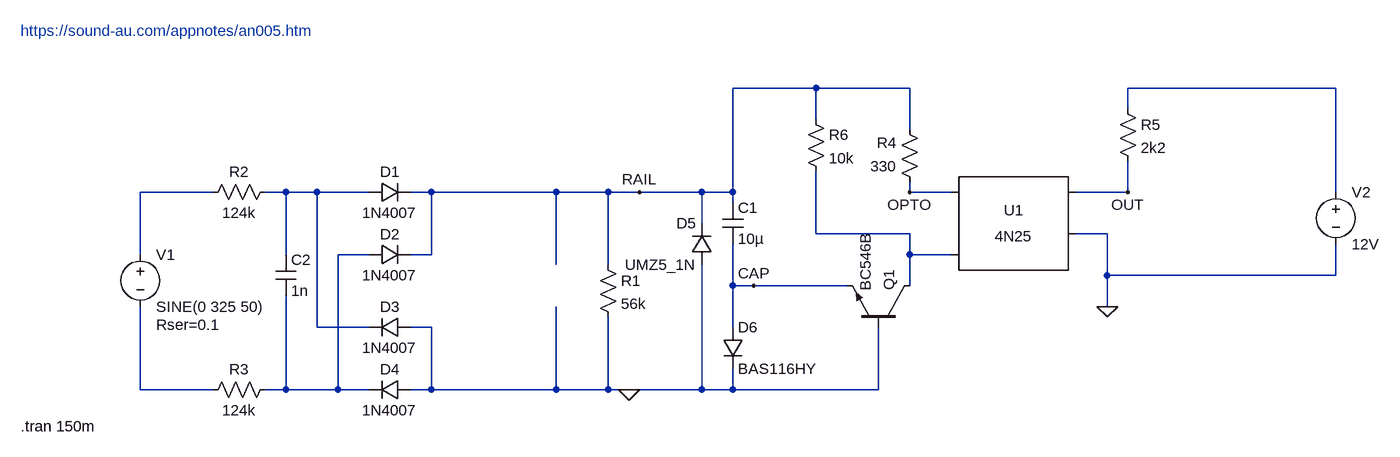
[diagram p0: schematic zero_crossing_ESP.asc]
zero_crossing_ESP.asc, the LTspice schematic file:
Version 4.1
SHEET 1 2200 752
WIRE 1168 112 1040 112
WIRE 1312 112 1168 112
WIRE 1968 112 1648 112
WIRE 1648 144 1648 112
WIRE 1168 160 1168 112
WIRE 1312 176 1312 112
WIRE 240 272 128 272
WIRE 352 272 320 272
WIRE 400 272 352 272
WIRE 480 272 400 272
WIRE 576 272 544 272
WIRE 768 272 576 272
WIRE 848 272 768 272
WIRE 896 272 848 272
WIRE 992 272 896 272
WIRE 1040 272 1040 112
WIRE 1040 272 992 272
WIRE 1312 272 1312 256
WIRE 1376 272 1312 272
WIRE 1648 272 1648 224
WIRE 1648 272 1568 272
WIRE 1968 272 1968 112
WIRE 1040 288 1040 272
WIRE 992 320 992 272
WIRE 1168 336 1168 240
WIRE 1312 336 1168 336
WIRE 1616 336 1568 336
WIRE 128 368 128 272
WIRE 352 368 352 272
WIRE 480 368 432 368
WIRE 576 368 576 272
WIRE 576 368 544 368
WIRE 1312 368 1312 336
WIRE 1376 368 1312 368
WIRE 768 384 768 272
WIRE 848 384 848 272
WIRE 1616 400 1616 336
WIRE 1968 400 1968 352
WIRE 1968 400 1616 400
WIRE 1040 416 1040 352
WIRE 1072 416 1040 416
WIRE 1216 416 1072 416
WIRE 1312 416 1312 368
WIRE 1616 448 1616 400
WIRE 400 480 400 272
WIRE 480 480 400 480
WIRE 576 480 544 480
WIRE 1040 480 1040 416
WIRE 128 576 128 448
WIRE 240 576 128 576
WIRE 352 576 352 432
WIRE 352 576 320 576
WIRE 432 576 432 368
WIRE 432 576 352 576
WIRE 480 576 432 576
WIRE 576 576 576 480
WIRE 576 576 544 576
WIRE 768 576 768 448
WIRE 768 576 576 576
WIRE 848 576 848 464
WIRE 848 576 768 576
WIRE 880 576 848 576
WIRE 992 576 992 384
WIRE 992 576 880 576
WIRE 1040 576 1040 544
WIRE 1040 576 992 576
WIRE 1264 576 1264 480
WIRE 1264 576 1040 576
FLAG 1616 448 0
FLAG 880 576 0
FLAG 1648 272 OUT
FLAG 896 272 RAIL
FLAG 1072 416 CAP
FLAG 1312 272 OPTO
SYMBOL diode 480 288 R270
WINDOW 0 32 32 VTop 2
WINDOW 3 0 32 VBottom 2
SYMATTR InstName D1
SYMATTR Value 1N4007
SYMBOL diode 480 384 R270
WINDOW 0 32 32 VTop 2
WINDOW 3 0 32 VBottom 2
SYMATTR InstName D2
SYMATTR Value 1N4007
SYMBOL diode 544 464 R90
WINDOW 0 0 32 VBottom 2
WINDOW 3 32 32 VTop 2
SYMATTR InstName D3
SYMATTR Value 1N4007
SYMBOL diode 544 560 R90
WINDOW 0 0 32 VBottom 2
WINDOW 3 32 32 VTop 2
SYMATTR InstName D4
SYMATTR Value 1N4007
SYMBOL voltage 128 352 R0
WINDOW 123 0 0 Left 0
WINDOW 39 24 124 Left 2
SYMATTR SpiceLine Rser=0.1
SYMATTR InstName V1
SYMATTR Value SINE(0 325 50)
SYMBOL res 832 368 R0
SYMATTR InstName R1
SYMATTR Value 56k
SYMBOL res 336 256 R90
WINDOW 0 0 56 VBottom 2
WINDOW 3 32 56 VTop 2
SYMATTR InstName R2
SYMATTR Value 124k
SYMBOL res 336 560 R90
WINDOW 0 0 56 VBottom 2
WINDOW 3 32 56 VTop 2
SYMATTR InstName R3
SYMATTR Value 124k
SYMBOL res 1328 272 R180
WINDOW 0 36 76 Left 2
WINDOW 3 36 40 Left 2
SYMATTR InstName R4
SYMATTR Value 330
SYMBOL res 1632 128 R0
SYMATTR InstName R5
SYMATTR Value 2k2
SYMBOL Optos\\4N25 1472 336 R0
SYMATTR InstName U1
SYMBOL diode 1024 480 R0
SYMATTR InstName D6
SYMATTR Value BAS116HY
SYMBOL cap 1024 288 R0
SYMATTR InstName C1
SYMATTR Value 10µ
SYMATTR SpiceLine Rser=0.8
SYMBOL voltage 1968 256 R0
WINDOW 123 0 0 Left 0
WINDOW 39 0 0 Left 0
SYMATTR InstName V2
SYMATTR Value 12V
SYMBOL cap 336 368 R0
SYMATTR InstName C2
SYMATTR Value 1n
SYMBOL npn 1312 480 M270
SYMATTR InstName Q1
SYMATTR Value BC546B
SYMBOL res 1152 144 R0
SYMATTR InstName R6
SYMATTR Value 10k
SYMBOL diode 1008 384 R180
WINDOW 0 24 64 Left 2
WINDOW 3 24 0 Left 2
SYMATTR InstName D5
SYMATTR Value UMZ5_1N
SYMATTR Description Diode
SYMATTR Type diode
TEXT -56 24 Left 2 ;https://sound-au.com/appnotes/an005.htm
TEXT -56 632 Left 2 !.tran 150m

The netlist it stands for:
* zero_crossing_ESP.asc
D1 N003 RAIL 1N4007
D2 N005 RAIL 1N4007
D3 0 N003 1N4007
D4 0 N005 1N4007
V1 N002 N006 SINE(0 325 50) Rser=0.1
R1 RAIL 0 56k
R2 N003 N002 124k
R3 N005 N006 124k
R4 OPTO RAIL 330
R5 N001 OUT 2k2
X§U1 OPTO N004 OUT 0 NC_01 4N25
D6 CAP 0 BAS116HY
C1 RAIL CAP 10µ Rser=0.8
V2 N001 0 12V
C2 N003 N005 1n
Q1 N004 0 CAP 0 BC546B
R6 RAIL N004 10k
D5 0 RAIL UMZ5_1N
.model D D
.lib standard.dio
.model NPN NPN
.model PNP PNP
.lib standard.bjt
* https://sound-au.com/appnotes/an005.htm
.tran 150m
.lib 4N25.sub
.backanno
.end